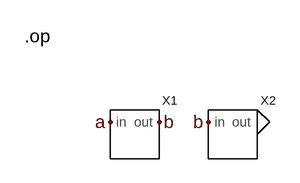
[diagram p0: schematic custom.asc]
custom.asc, the LTspice schematic file:
Version 4
SHEET 1 800 600
FLAG 128 144 a
FLAG 192 144 b
FLAG 256 144 b
FLAG 320 144 0
SYMBOL custom 128 128 R0
SYMATTR InstName X1
SYMBOL custom 256 128 R0
SYMATTR InstName X2
TEXT 16 32 Left 2 !.op

The netlist it stands for:
* custom.asc
XX1 a b ext  ; pins in out
XX2 b 0 ext  ; pins in out
.op
.lib ext.lib
.backanno
.end